# Altium schematic sheet 03_Sensores.SchDoc
size A; SheetNumber: 3; SheetTotal: 4
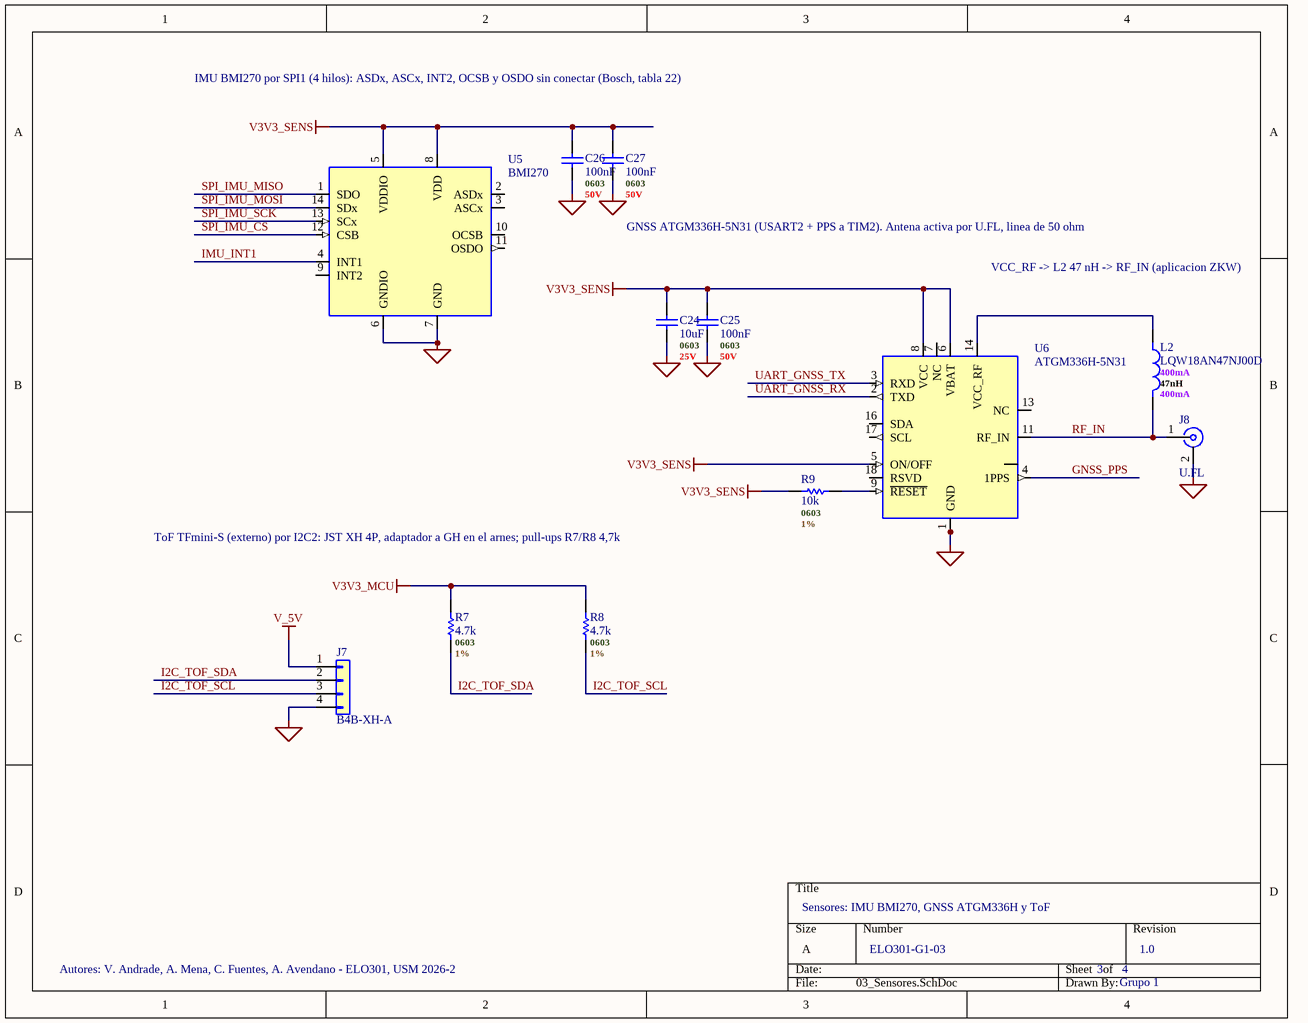
[diagram p0: 03_Sensores.SchDoc]

## Parts
C24  10uF  .Case/Package: 0603  .Voltage Rating (DC): 25V  [C0603 - MURATA]
C25  100nF  .Case/Package: 0603  .Voltage Rating (DC): 50V  [C0603 - MURATA]
C26  100nF  .Case/Package: 0603  .Voltage Rating (DC): 50V  [C0603 - MURATA]
C27  100nF  .Case/Package: 0603  .Voltage Rating (DC): 50V  [C0603 - MURATA]
J7  B4B-XH-A  [B4B-XH-A - JST]
J8  U.FL  [U.FL - HIROSE]
L2  LQW18AN47NJ00D  .RMS Current (Irms): 400mA  .Value: 47nH  [L0603 - GENERIC]
R7  4.7k  .Case/Package: 0603  .Tolerance: 1%  [R0603 - YAGEO]
R8  4.7k  .Case/Package: 0603  .Tolerance: 1%  [R0603 - YAGEO]
R9  10k  .Case/Package: 0603  .Tolerance: 1%  [R0603 - YAGEO]
U5  BMI270  [LGA-14 2.5x3.0 - BOSCH]
U6  ATGM336H-5N31  [LCC-18 9.7x10.1 - ZKW]

## Nets
GND: C24.2 C25.2 C26.2 C27.2 J7.4(Pin_4) J8.2(Ext) U5.6(GNDIO) U5.7(GND) U6.1(GND) U6.10(GND) U6.12(GND)
V3V3_MCU: R7.2 R8.2
V3V3_SENS: C24.1 C25.1 C26.1 C27.1 R9.1 U5.5(VDDIO) U5.8(VDD) U6.5(ON/OFF) U6.6(VBAT) U6.8(VCC)
V_5V: J7.1(Pin_1)
GNSS_PPS: U6.4(1PPS)
I2C_TOF_SCL: J7.3(Pin_3) R8.1
I2C_TOF_SDA: J7.2(Pin_2) R7.1
IMU_INT1: U5.4(INT1)
RF_IN: J8.1(In) L2.2 U6.11(RF_IN)
SPI_IMU_CS: U5.12(CSB)
SPI_IMU_MISO: U5.1(SDO)
SPI_IMU_MOSI: U5.14(SDx)
SPI_IMU_SCK: U5.13(SCx)
UART_GNSS_RX: U6.2(TXD)
UART_GNSS_TX: U6.3(RXD)
NetL2_1: L2.1 U6.14(VCC_RF)
NetR9_2: R9.2 U6.9(~{RESET})

Not connected (* = marked no-connect by the designer): U5 2(ASDx) 3(ASCx) 9(INT2) 10(OCSB) 11(OSDO); U6 7(NC) 13(NC) 15(RSVD) 16(SDA) 17(SCL) 18(RSVD)

## Notes on the sheet
- IMU BMI270 por SPI1 (4 hilos): ASDx, ASCx, INT2, OCSB y OSDO sin conectar (Bosch, tabla 22)
- GNSS ATGM336H-5N31 (USART2 + PPS a TIM2). Antena activa por U.FL, linea de 50 ohm
- VCC_RF -> L2 47 nH -> RF_IN (aplicacion ZKW)
- ToF TFmini-S (externo) por I2C2: JST XH 4P, adaptador a GH en el arnes; pull-ups R7/R8 4,7k
- Sensores: IMU BMI270, GNSS ATGM336H y ToF
- Autores: V. Andrade, A. Mena, C. Fuentes, A. Avendano - ELO301, USM 2026-2
- ELO301-G1-03
- 3
- 4
- 1.0
- Grupo 1

## Library data of the parts
C24 = CAP - GENERIC: 10 µF ±20% 25V Ceramic Capacitor X5R 0603 (1608 Metric); Manufacturer: Murata Electronics; Manufacturer Part Number: GRM188R61E106MA73D; Case/Package: 0603; Voltage Rating (DC): 25V; Supplier 1: DigiKey; Supplier Part Number 1: 490-7202-1-ND; Supplier 2: LCSC; Supplier Part Number 2: C91606; Category: Ceramic Capacitors; Operating Temperature: -55°C ~ 85°C; Lifecycle Status: Active; ComponentLink1Description: Datasheet; ComponentLink1URL: https://mm.digikey.com/Volume0/opasdata/d220001/medias/docus/8942/Chip_Multilayer_CAT2021_MLCC.pdf; ComponentLink2Description: DigiKey; ComponentLink2URL: https://www.digikey.com/en/products/result?keywords=GRM188R61E106MA73D
C25-C27 = CAP - GENERIC: 0.1 µF ±10% 50V Ceramic Capacitor X7R 0603 (1608 Metric); Manufacturer: Murata Electronics; Manufacturer Part Number: GCM188R71H104KA57D; Case/Package: 0603; Voltage Rating (DC): 50V; Supplier 1: DigiKey; Supplier Part Number 1: 490-4779-1-ND; Category: Ceramic Capacitors; Operating Temperature: -55°C ~ 125°C; Lifecycle Status: Active; ComponentLink1Description: Datasheet; ComponentLink1URL: https://pim.murata.com/asset/pim4/ceramicCapacitorSMD/GCM188R71H104KA57-01A-EN_PDF_CERAMICCAPACITORSMD; ComponentLink2Description: DigiKey; ComponentLink2URL: https://www.digikey.com/en/products/result?keywords=GCM188R71H104KA57D
J7 = B4B-XH-A(LF)(SN): Connector Header Through Hole 4 position 0.098" (2.50mm); Manufacturer: JST Sales America Inc.; Manufacturer Part Number: B4B-XH-A(LF)(SN); Supplier 1: DigiKey; Supplier Part Number 1: 455-B4B-XH-A-ND; Supplier 2: LCSC; Supplier Part Number 2: C144395; Category: Headers, Male Pins; Case/Package: Through Hole; Operating Temperature: -25°C ~ 85°C; Lifecycle Status: Active; ComponentLink1Description: Datasheet; ComponentLink1URL: https://www.jst-mfg.com/product/pdf/eng/eXH.pdf; ComponentLink2Description: DigiKey; ComponentLink2URL: https://www.digikey.com/en/products/result?keywords=B4B-XH-A
J8 = U.FL-R-SMT-1(10): U.FL (UMCC) Connector Receptacle, Male Pin 50 Ohms Surface Mount Solder; Manufacturer: Hirose Electric Co Ltd; Manufacturer Part Number: U.FL-R-SMT-1(10); Supplier 1: DigiKey; Supplier Part Number 1: H11891CT-ND; Supplier 2: LCSC; Supplier Part Number 2: C88373; Category: Coaxial Connectors (RF); Case/Package: Surface Mount; Operating Temperature: -40°C ~ 90°C; Lifecycle Status: Active; ComponentLink1Description: Datasheet; ComponentLink1URL: https://mm.digikey.com/Volume0/opasdata/d220001/medias/docus/8942/HIROS08829-1.pdf; ComponentLink2Description: DigiKey; ComponentLink2URL: https://www.digikey.com/en/products/result?keywords=U.FL-R-SMT-1(10)
L2 = INDUCTOR - GENERIC: 47 nH Unshielded Drum Core, Wirewound Inductor 380 mA 290mOhm Max 0603 (1608 Metric); Manufacturer: Murata Electronics; Value: 47nH; .Max DC Current: 400mA; Manufacturer Part Number: LQW18AN47NJ00D; RMS Current (Irms): 400mA; Max DC Current: 400mA; Supplier 1: DigiKey; Supplier Part Number 1: 490-6895-1-ND; Supplier 2: LCSC; Supplier Part Number 2: C98077; Category: Fixed Inductors; Operating Temperature: -55°C ~ 125°C; Lifecycle Status: Active; ComponentLink1Description: Datasheet; ComponentLink1URL: https://pim.murata.com/asset/pim4/inductor/JELF243A-0024_PDF_INDUCTOR; ComponentLink2Description: DigiKey; ComponentLink2URL: https://www.digikey.com/en/products/result?keywords=LQW18AN47NJ00D
R7 R8 = RESISTOR - GENERIC: 4.7 kOhms ±1% 0.1W, 1/10W Chip Resistor 0603 (1608 Metric) Moisture Resistant Thick Film; Manufacturer: YAGEO; Manufacturer Part Number: RC0603FR-074K7L; Case/Package: 0603; Tolerance: 1%; Supplier 1: DigiKey; Supplier Part Number 1: 311-4.70KHRCT-ND; Supplier 2: LCSC; Supplier Part Number 2: C99782; Category: Chip Resistor - Surface Mount; Operating Temperature: -55°C ~ 155°C; Lifecycle Status: Active; ComponentLink1Description: Datasheet; ComponentLink1URL: https://yageogroup.com/content/datasheet/asset/file/PYU-RC_GROUP_51_ROHS_L; ComponentLink2Description: DigiKey; ComponentLink2URL: https://www.digikey.com/en/products/result?keywords=RC0603FR-074K7L
R9 = RESISTOR - GENERIC: 10 kOhms ±1% 0.1W, 1/10W Chip Resistor 0603 (1608 Metric) Moisture Resistant Thick Film; Manufacturer: YAGEO; Manufacturer Part Number: RC0603FR-0710KL; Case/Package: 0603; Tolerance: 1%; Supplier 1: DigiKey; Supplier Part Number 1: 311-10.0KHRCT-ND; Supplier 2: LCSC; Supplier Part Number 2: C98220; Category: Chip Resistor - Surface Mount; Operating Temperature: -55°C ~ 155°C; Lifecycle Status: Active; ComponentLink1Description: Datasheet; ComponentLink1URL: https://yageogroup.com/content/datasheet/asset/file/PYU-RC_GROUP_51_ROHS_L; ComponentLink2Description: DigiKey; ComponentLink2URL: https://www.digikey.com/en/products/result?keywords=RC0603FR-0710KL
U5 = BMI270: Accelerometer, Gyroscope, 6 Axis Sensor I2C, SPI Output; Manufacturer: Bosch Sensortec; Manufacturer Part Number: BMI270; Supplier 1: DigiKey; Supplier Part Number 1: 828-1091-1-ND; Supplier 2: LCSC; Supplier Part Number 2: C2836813; Category: IMUs (Inertial Measurement Units); Case/Package: 14-VFLGA; Supplier Device Package: 14-LGA (2.5x3); Operating Temperature: -40°C ~ 85°C; Lifecycle Status: Active; ComponentLink1Description: Datasheet; ComponentLink1URL: https://www.bosch-sensortec.com/media/boschsensortec/downloads/datasheets/bst-bmi270-ds000.pdf; ComponentLink2Description: DigiKey; ComponentLink2URL: https://www.digikey.com/en/products/result?keywords=BMI270
U6 = ATGM336H-5N31: BDS/GNSS All-constellation Positioning and Navigation Module; Manufacturer: ZHONGKEWEI; Manufacturer Part Number: ATGM336H-5N31; Supplier 1: LCSC; Supplier Part Number 1: C90770; Category: RF Receivers; Case/Package: SMD, 10.1x9.7mm; Operating Temperature: -40°C ~ 85°C; Lifecycle Status: Active; ComponentLink1Description: Datasheet; ComponentLink1URL: https://www.lcsc.com/datasheet/C90770.pdf; ComponentLink2Description: LCSC; ComponentLink2URL: https://www.lcsc.com/product-detail/C90770.html; Nota DigiKey: No disponible en DigiKey: excepcion documentada (como el U.FL en el documento de diseno)